# Altium schematic sheet Connector-Sheet.SchDoc
size 420 x 297 mm; SheetNumber: 10; SheetTotal: 10
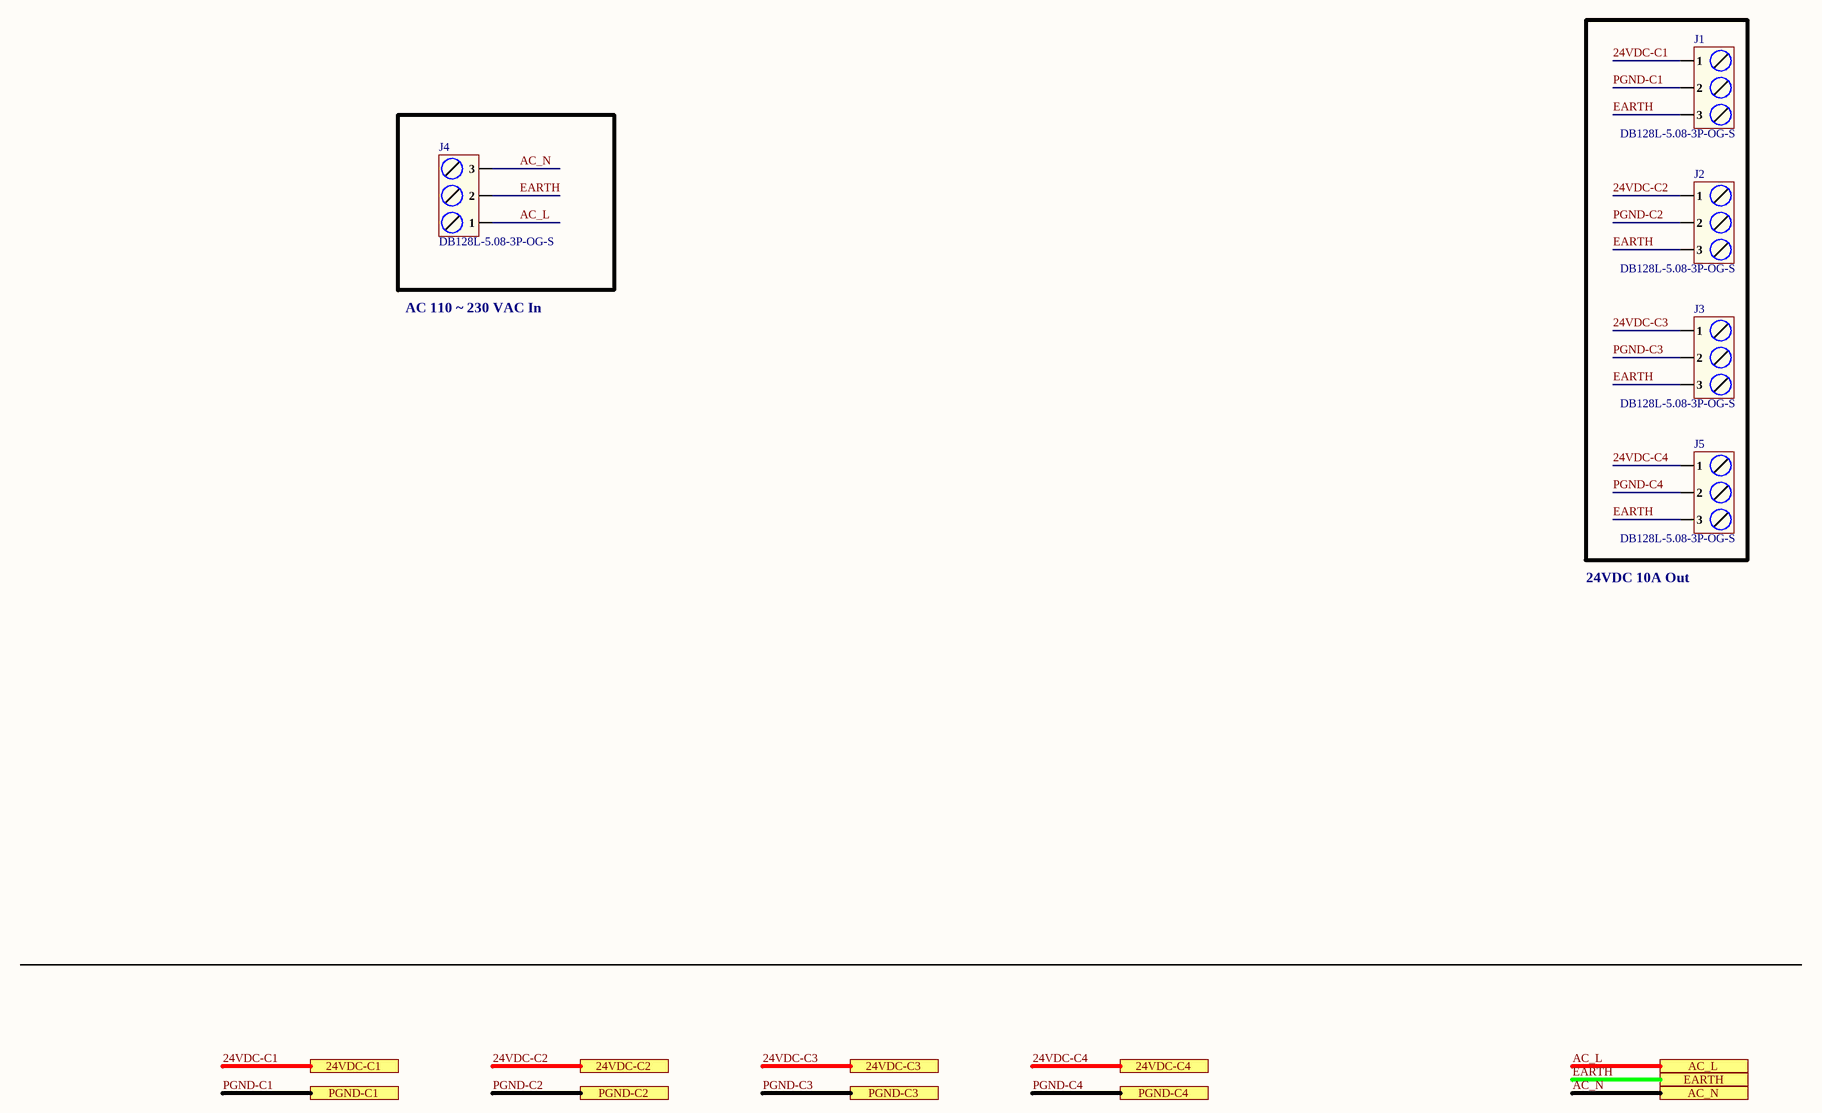
[diagram p0: Connector-Sheet.SchDoc]

## Parts
J1  DB128L-5.08-3P-OG-S  [DB128L-5.08-3P-OG-S]
J2  DB128L-5.08-3P-OG-S  [DB128L-5.08-3P-OG-S]
J3  DB128L-5.08-3P-OG-S  [DB128L-5.08-3P-OG-S]
J4  DB128L-5.08-3P-OG-S  [DB128L-5.08-3P-OG-S]
J5  DB128L-5.08-3P-OG-S  [DB128L-5.08-3P-OG-S]

## Ports
24VDC-C1 (see Top-Sheet[3C], Power_Controller-Sheet[1D]), 24VDC-C2 (see Top-Sheet[3C], Power_Controller-Sheet-ch2[1D]), 24VDC-C3 (see Top-Sheet[3C], Power_Controller-Sheet-ch3[1D]), 24VDC-C4 (see Top-Sheet[3C], Power_Controller-Sheet-ch4[1D]), AC_L (see Top-Sheet[3C], PFC-Sheet-ch2[4D], PFC-Sheet-ch3[4D], PFC-Sheet-ch4[4D], PFC-Sheet[4D]), AC_N (see Top-Sheet[3C], PFC-Sheet-ch2[4D], PFC-Sheet-ch3[4D], PFC-Sheet-ch4[4D], PFC-Sheet[4D]), EARTH (see Top-Sheet[3C], PFC-Sheet-ch2[4D], PFC-Sheet-ch3[4D], PFC-Sheet-ch4[4D], PFC-Sheet[4D]), PGND-C1 (see Top-Sheet[3C], Power_Controller-Sheet[1D]), PGND-C2 (see Top-Sheet[3C], Power_Controller-Sheet-ch2[1D]), PGND-C3 (see Top-Sheet[3C], Power_Controller-Sheet-ch3[1D]), PGND-C4 (see Top-Sheet[3C], Power_Controller-Sheet-ch4[1D])

## Nets
24VDC-C1: J1.1 ; port 24VDC-C1
24VDC-C2: J2.1 ; port 24VDC-C2
24VDC-C3: J3.1 ; port 24VDC-C3
24VDC-C4: J5.1 ; port 24VDC-C4
AC_L: J4.1 ; port AC_L
AC_N: J4.3 ; port AC_N
EARTH: J1.3 J2.3 J3.3 J4.2 J5.3 ; port EARTH
PGND-C1: J1.2 ; port PGND-C1
PGND-C2: J2.2 ; port PGND-C2
PGND-C3: J3.2 ; port PGND-C3
PGND-C4: J5.2 ; port PGND-C4

## Notes on the sheet
- AC 110 ~ 230 VAC In
- (near J5) 24VDC 10A Out
- File:
- Title:
- Date:
- Page
- Num:
- Total:
- Drawn By: Huzaifa Ali

## Library data of the parts
J1-J5 = DB128L-5.08-3P-OG-S: 1x3P 18A -40℃~+105℃ 250V Orange 12~30 Direct Insert 5.08mm 2.5 1 3 Plugin,P=5.08mm Screw Terminal Blocks ROHS; Manufacturer: DORABO; Manufacturer Part Number: DB128L-5.08-3P-OG-S; Package: Plugin,P=5.08mm; LCSC Part Number: C430604; Item Type: Terminal Block; ComponentLink1Description: LCSC; ComponentLink1URL: https://www.lcsc.com/product-detail/Screw-Terminal-Blocks_DORABO-DB128L-5-08-3P-OG-S_C430604.html